# EasyEDA Pro project esp32s3clock.epro, board PCB3
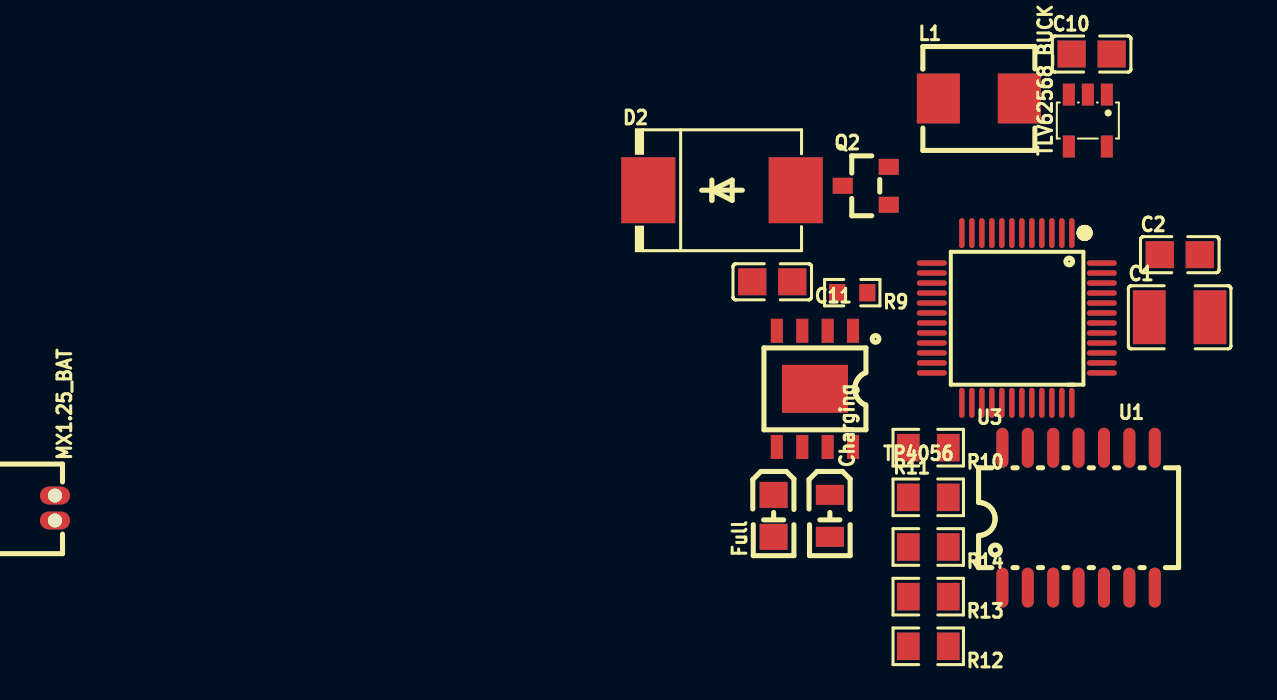
[diagram p9: board, top side]
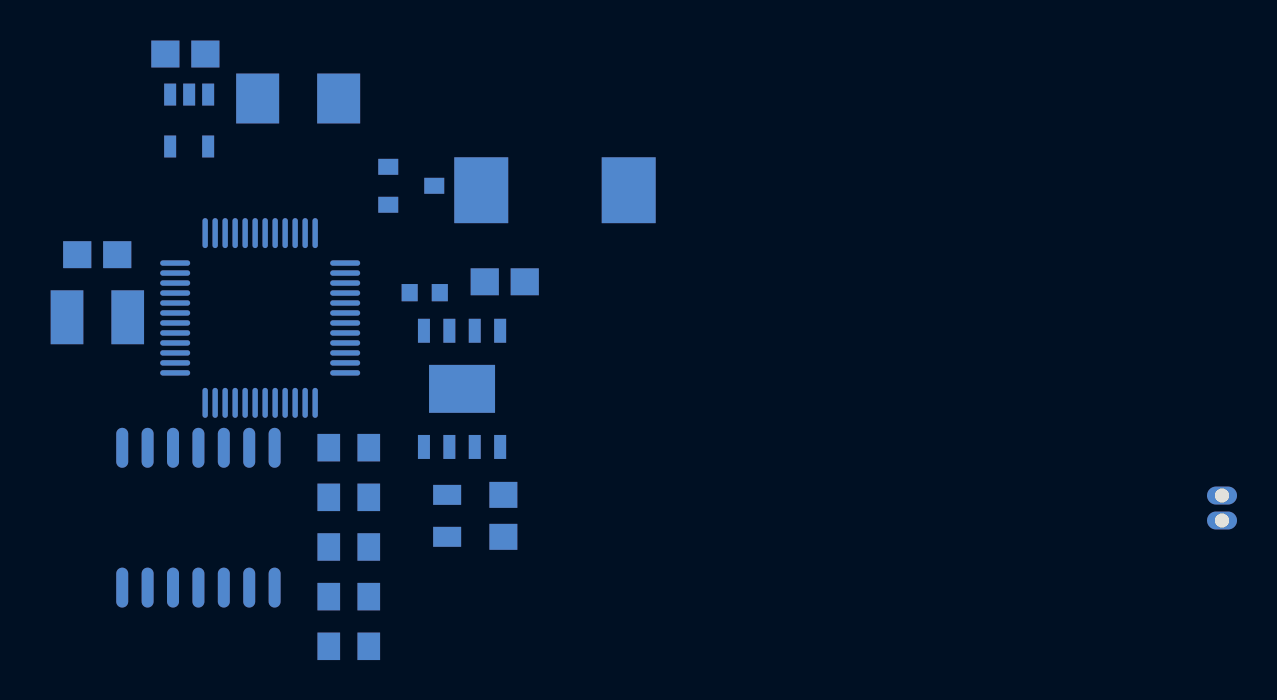
[diagram p10: board, bottom side, seen from below]

No outline. copper layers: Top Layer, Bottom Layer. Coordinates in mm from the lowest, leftmost part position.
Stack: Top Layer 0.035mm / Dielectric1 1.51mm FR4 er 4.5 / Bottom Layer 0.035mm

## Design rules (mm)
spacing copperThickness1oz (default): track to track 0.102, other pairs 0.152 to 0.3
spacing copperThickness2oz: track to track 0.203, other pairs 0.152 to 0.3
track width copperThickness1oz (default): min 0.127, default 0.254, max 2.54
track width copperThickness2oz: min 0.203, default 0.254, max 2.54
differential pair differentialPair (default): width min 0.127, default 0.254, max 2.54; gap min 0.152, default 0.152

## Placement (name value [footprint] x y rotation side)
C1  22uF  [C1210]  56.23 16.47 0 top
C2  100nF  [C0805]  56.24 19.61 0 top
C10  10uF  [C0805]  51.83 29.66 0 top
C11  10uF  [C0805]  35.86 18.25 180 top
Charging  GL0805UR01  [LED0805-R-RD_RED]  38.74 6.53 270 top
D2  SS34  [SMC_L6.9-W5.9-LS7.9-RD]  33.35 22.84 0 top
Full  GL0805UG01  [LED0805-FD_GL0805UG01]  35.93 6.53 90 top
L1  DH0520H-2R2M  [IND-SMD_L5.6-W5.2_MST0530H-150M]  46.19 27.43 0 top
MX1.25_BAT  ZX-MX1.25-2PWZ  [CONN-TH_2P-P1.25_ZX-MX1.25-2PWZ]  0 6.92 270 top
Q2  AO3401A  [SOT-23_L2.9-W1.3-P1.90-LS2.4-BR]  40.54 23.06 0 top
R9  2.4kΩ  [R0603]  39.86 17.71 180 top
R10  100kΩ  [R0805]  43.66 9.95 180 top
R11  22kΩ  [R0805]  43.66 7.46 0 top
R12  1kΩ  [R0805]  43.66 0 180 top
R13  1kΩ  [R0805]  43.66 2.49 180 top
R14  100kΩ  [R0805]  43.66 4.97 180 top
TLV62568_BUCK  TLV62568DBVR  [SOT-23-5_L3.0-W1.7-P0.95-LS2.8-BR]  51.64 26.33 90 top
TP4056  TP4056  [ESOP-8_L4.9-W3.9-P1.27-LS6.0-BL-EP]  38 12.89 180 top
U1  STC32G12K128-35I-LQFP48  [LQFP-48_L7.0-W7.0-P0.50-LS9.0-BL]  48.09 16.44 180 top
U3  RX8025T-UC  [SOIC-14_L10.1-W5.0-P1.27-LS7.4-BL]  51.18 6.44 0 top

## Footprints (pads in the part's own frame, mm; a bottom-side part is the same pattern mirrored in y, then rotated)
C0805
  rect 1.41x1.35 hole 0.001: 1(-1,0) 2(1,0)
C1210
  rect 1.635x2.7 hole 0.001: 1(-1.518,0) 2(1.518,0)
CONN-TH_2P-P1.25_ZX-MX1.25-2PWZ
  oval 0.9x1.5 hole 0.7: 1(-0.625,0) 2(0.625,0)
ESOP-8_L4.9-W3.9-P1.27-LS6.0-BL-EP
  rect 0.6x1.2 hole 0.001: 1(-1.905,-2.909) 2(-0.635,-2.909) 3(0.635,-2.909) 4(1.905,-2.909) 5(1.905,2.909) 6(0.635,2.909) 7(-0.635,2.909) 8(-1.905,2.909)
  rect 3.3x2.4 hole 0.001: 9(0,0)
IND-SMD_L5.6-W5.2_MST0530H-150M
  rect 2.15x2.5 hole 0.001: 1(-2.025,0) 2(2.025,0)
LED0805-FD_GL0805UG01
  rect 1.3x1.399 hole 0.001: 1(-1.05,0) 2(1.05,0)
LED0805-R-RD_RED
  rect 1x1.399 hole 0.001: 1(1.05,0) 2(-1.05,0)
LQFP-48_L7.0-W7.0-P0.50-LS9.0-BL
  oval 0.27x1.5 hole 0.001: 1(-2.75,-4.25) 2(-2.25,-4.25) 3(-1.75,-4.25) 4(-1.25,-4.25) 5(-0.75,-4.25) 6(-0.25,-4.25) 7(0.25,-4.25) 8(0.75,-4.25) 9(1.25,-4.25) 10(1.75,-4.25) 11(2.25,-4.25) 12(2.75,-4.25) 25(2.75,4.25) 26(2.25,4.25) 27(1.75,4.25) 28(1.25,4.25) 29(0.75,4.25) 30(0.25,4.25) 31(-0.25,4.25) 32(-0.75,4.25) 33(-1.25,4.25) 34(-1.75,4.25) 35(-2.25,4.25) 36(-2.75,4.25)
  oval 1.5x0.27 hole 0.001: 13(4.25,-2.75) 14(4.25,-2.25) 15(4.25,-1.75) 16(4.25,-1.25) 17(4.25,-0.75) 18(4.25,-0.25) 19(4.25,0.25) 20(4.25,0.75) 21(4.25,1.25) 22(4.25,1.75) 23(4.25,2.25) 24(4.25,2.75) 37(-4.25,2.75) 38(-4.25,2.25) 39(-4.25,1.75) 40(-4.25,1.25) 41(-4.25,0.75) 42(-4.25,0.25) 43(-4.25,-0.25) 44(-4.25,-0.75) 45(-4.25,-1.25) 46(-4.25,-1.75) 47(-4.25,-2.25) 48(-4.25,-2.75)
R0603
  rect 0.806x0.864 hole 0.001: 1(-0.753,0) 2(0.753,0)
R0805
  rect 1.133x1.377 hole 0.001: 1(-1,0) 2(1,0)
SMC_L6.9-W5.9-LS7.9-RD
  rect 2.7x3.3 hole 0.001: 1(-3.687,0) 2(3.687,0)
SOIC-14_L10.1-W5.0-P1.27-LS7.4-BL
  oval 0.6x2 hole 0.001: 1(-3.81,-3.5) 2(-2.54,-3.5) 3(-1.27,-3.5) 4(0,-3.5) 5(1.27,-3.5) 6(2.54,-3.5) 7(3.81,-3.5) 8(3.81,3.5) 9(2.54,3.5) 10(1.27,3.5) 11(0,3.5) 12(-1.27,3.5) 13(-2.54,3.5) 14(-3.81,3.5)
SOT-23-5_L3.0-W1.7-P0.95-LS2.8-BR
  rect 1.1x0.6 hole 0.001: 1(1.3,-0.95) 2(1.3,0) 3(1.3,0.95) 4(-1.3,0.95) 5(-1.3,-0.95)
SOT-23_L2.9-W1.3-P1.90-LS2.4-BR
  rect 1x0.8 hole 0.001: 1(1.15,-0.95) 2(1.15,0.95) 3(-1.15,0)

## Nets
As in the schematic.

Pads without a net: U1 1 2 3 4 5 6 7 8 9 10 11 12 13 14 15 16 17 18 19 20 21 22 23 24 25 26 27 28 29 30 31 32 33 34 35 36 37 38 39 40 41 42 43 44 45 46 47 48; U3 1 2 3 4 5 6 7 8 9 10 11 12 13 14
